# Altium schematic sheet Header_Sheet_4.SchDoc
size A4; SheetNumber: 10; SheetTotal: 12
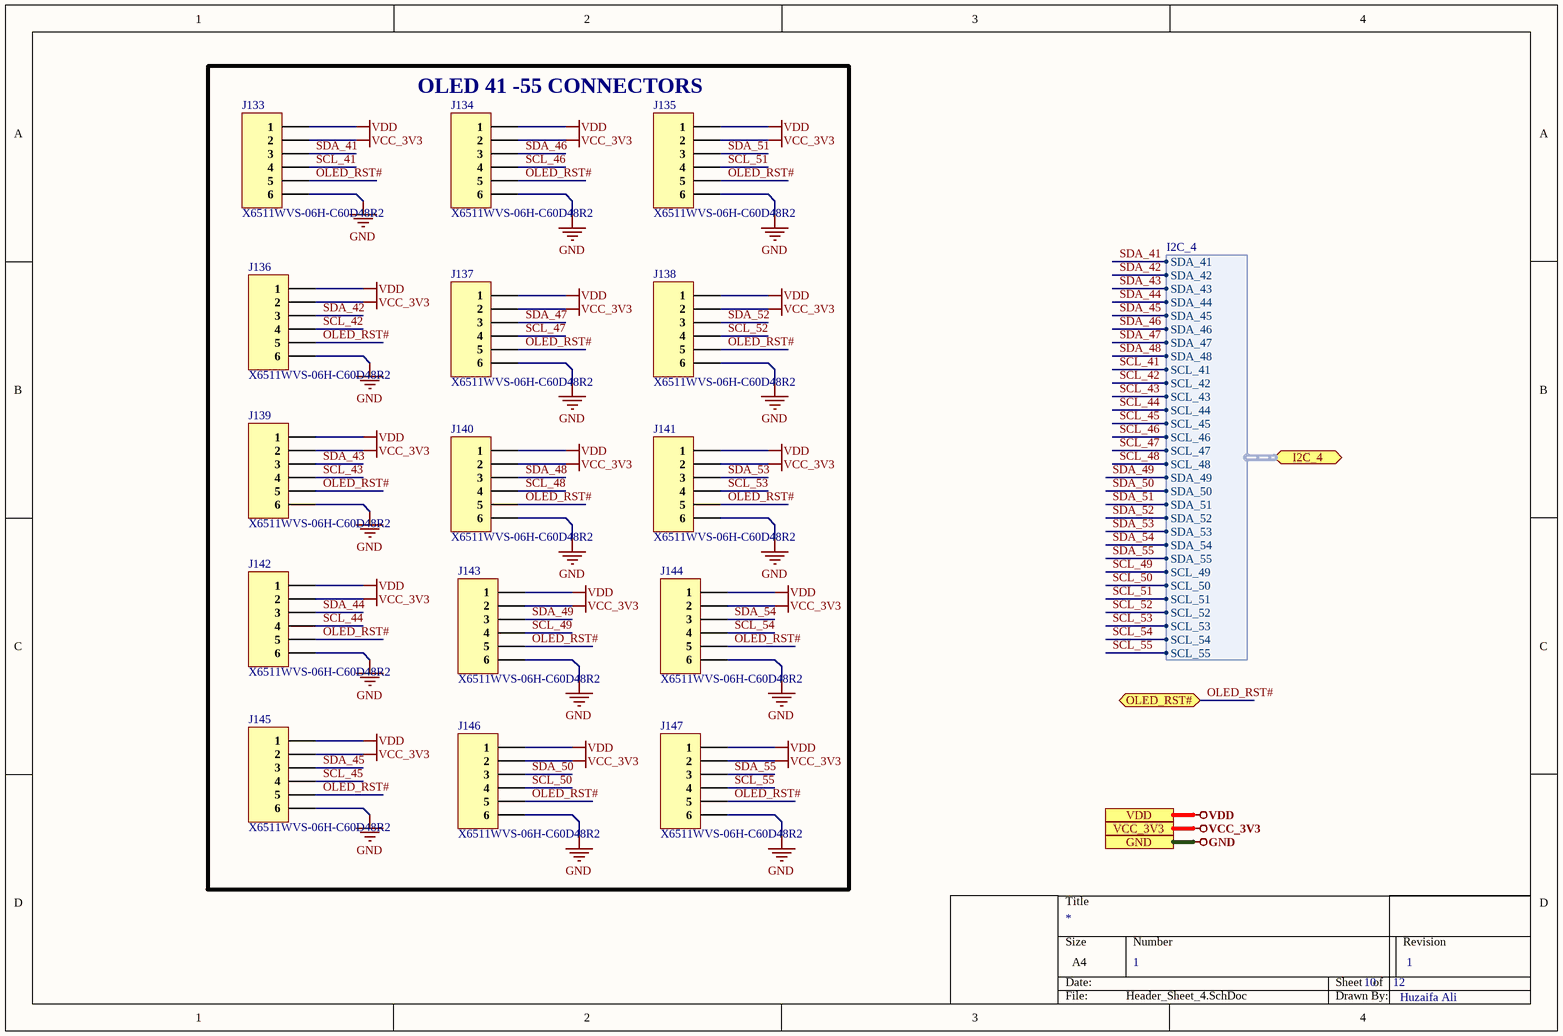
[diagram p0: Header_Sheet_4.SchDoc]

## Parts
J133  X6511WVS-06H-C60D48R2  [X6511WVS-06H-C60D48R2]
J134  X6511WVS-06H-C60D48R2  [X6511WVS-06H-C60D48R2]
J135  X6511WVS-06H-C60D48R2  [X6511WVS-06H-C60D48R2]
J136  X6511WVS-06H-C60D48R2  [X6511WVS-06H-C60D48R2]
J137  X6511WVS-06H-C60D48R2  [X6511WVS-06H-C60D48R2]
J138  X6511WVS-06H-C60D48R2  [X6511WVS-06H-C60D48R2]
J139  X6511WVS-06H-C60D48R2  [X6511WVS-06H-C60D48R2]
J140  X6511WVS-06H-C60D48R2  [X6511WVS-06H-C60D48R2]
J141  X6511WVS-06H-C60D48R2  [X6511WVS-06H-C60D48R2]
J142  X6511WVS-06H-C60D48R2  [X6511WVS-06H-C60D48R2]
J143  X6511WVS-06H-C60D48R2  [X6511WVS-06H-C60D48R2]
J144  X6511WVS-06H-C60D48R2  [X6511WVS-06H-C60D48R2]
J145  X6511WVS-06H-C60D48R2  [X6511WVS-06H-C60D48R2]
J146  X6511WVS-06H-C60D48R2  [X6511WVS-06H-C60D48R2]
J147  X6511WVS-06H-C60D48R2  [X6511WVS-06H-C60D48R2]

## Blocks framed on the sheet
OLED 41 -55 CONNECTORS: J133-J147

## Ports
GND, I2C_4 (bidir, harness I2C_4), OLED_RST# (bidir), VCC_3V3, VDD

## Harnesses
I2C_4: SDA_41, SDA_42, SDA_43, SDA_44, SDA_45, SDA_46, SDA_47, SDA_48, SCL_41, SCL_42, SCL_43, SCL_44, SCL_45, SCL_46, SCL_47, SCL_48, SDA_49, SDA_50, SDA_51, SDA_52, SDA_53, SDA_54, SDA_55, SCL_49, SCL_50, SCL_51, SCL_52, SCL_53, SCL_54, SCL_55

## Nets
GND: J133.6 J134.6 J135.6 J136.6 J137.6 J138.6 J139.6 J140.6 J141.6 J142.6 J143.6 J144.6 J145.6 J146.6 J147.6 ; port GND
VCC_3V3: J133.2 J134.2 J135.2 J136.2 J137.2 J138.2 J139.2 J140.2 J141.2 J142.2 J143.2 J144.2 J145.2 J146.2 J147.2 ; port VCC_3V3
VDD: J133.1 J134.1 J135.1 J136.1 J137.1 J138.1 J139.1 J140.1 J141.1 J142.1 J143.1 J144.1 J145.1 J146.1 J147.1 ; port VDD
OLED_RST#: J133.5 J134.5 J135.5 J136.5 J137.5 J138.5 J139.5 J140.5 J141.5 J142.5 J143.5 J144.5 J145.5 J146.5 J147.5 ; port OLED_RST#
SCL_41: J133.4 ; port I2C_4.SCL_41
SCL_42: J136.4 ; port I2C_4.SCL_42
SCL_43: J139.4 ; port I2C_4.SCL_43
SCL_44: J142.4 ; port I2C_4.SCL_44
SCL_45: J145.4 ; port I2C_4.SCL_45
SCL_46: J134.4 ; port I2C_4.SCL_46
SCL_47: J137.4 ; port I2C_4.SCL_47
SCL_48: J140.4 ; port I2C_4.SCL_48
SCL_49: J143.4 ; port I2C_4.SCL_49
SCL_50: J146.4 ; port I2C_4.SCL_50
SCL_51: J135.4 ; port I2C_4.SCL_51
SCL_52: J138.4 ; port I2C_4.SCL_52
SCL_53: J141.4 ; port I2C_4.SCL_53
SCL_54: J144.4 ; port I2C_4.SCL_54
SCL_55: J147.4 ; port I2C_4.SCL_55
SDA_41: J133.3 ; port I2C_4.SDA_41
SDA_42: J136.3 ; port I2C_4.SDA_42
SDA_43: J139.3 ; port I2C_4.SDA_43
SDA_44: J142.3 ; port I2C_4.SDA_44
SDA_45: J145.3 ; port I2C_4.SDA_45
SDA_46: J134.3 ; port I2C_4.SDA_46
SDA_47: J137.3 ; port I2C_4.SDA_47
SDA_48: J140.3 ; port I2C_4.SDA_48
SDA_49: J143.3 ; port I2C_4.SDA_49
SDA_50: J146.3 ; port I2C_4.SDA_50
SDA_51: J135.3 ; port I2C_4.SDA_51
SDA_52: J138.3 ; port I2C_4.SDA_52
SDA_53: J141.3 ; port I2C_4.SDA_53
SDA_54: J144.3 ; port I2C_4.SDA_54
SDA_55: J147.3 ; port I2C_4.SDA_55

## Notes on the sheet
- 1
- Huzaifa Ali

## Library data of the parts
J133-J147 = X6511WVS-06H-C60D48R2: 6 POS 2.54mm SMD Header; Manufacturer: XKB Connectivity; Voltage Rating (Max): 250V; Current Rating (Max): 3A; Circluar Pins/Square Pins: Square Pins; ComponentLink1Description: LCSC; ComponentLink1URL: https://lcsc.com/product-detail/span-style-background-color-ff0-Pin-span-Headers_XKB-Connectivity-X6511WVS-06H-C60D48R2_C2883763.html; Insulation Height: 2.5mm; Length of Mating Pin: 6mm